# Altium schematic sheet 04_Main.SchDoc
size 779 x 360 mm; DsnPath: C:\Users\nilot\Documents\VSCode\SBC\imports\SG2002_QFN88_38_20230301_4L_V1.3_16.2.DSN; SchematicName: CV181xC_QFN88_38_DemoBoard; PageName: 04_Main; PageSize: Custom; TopSchematic: True
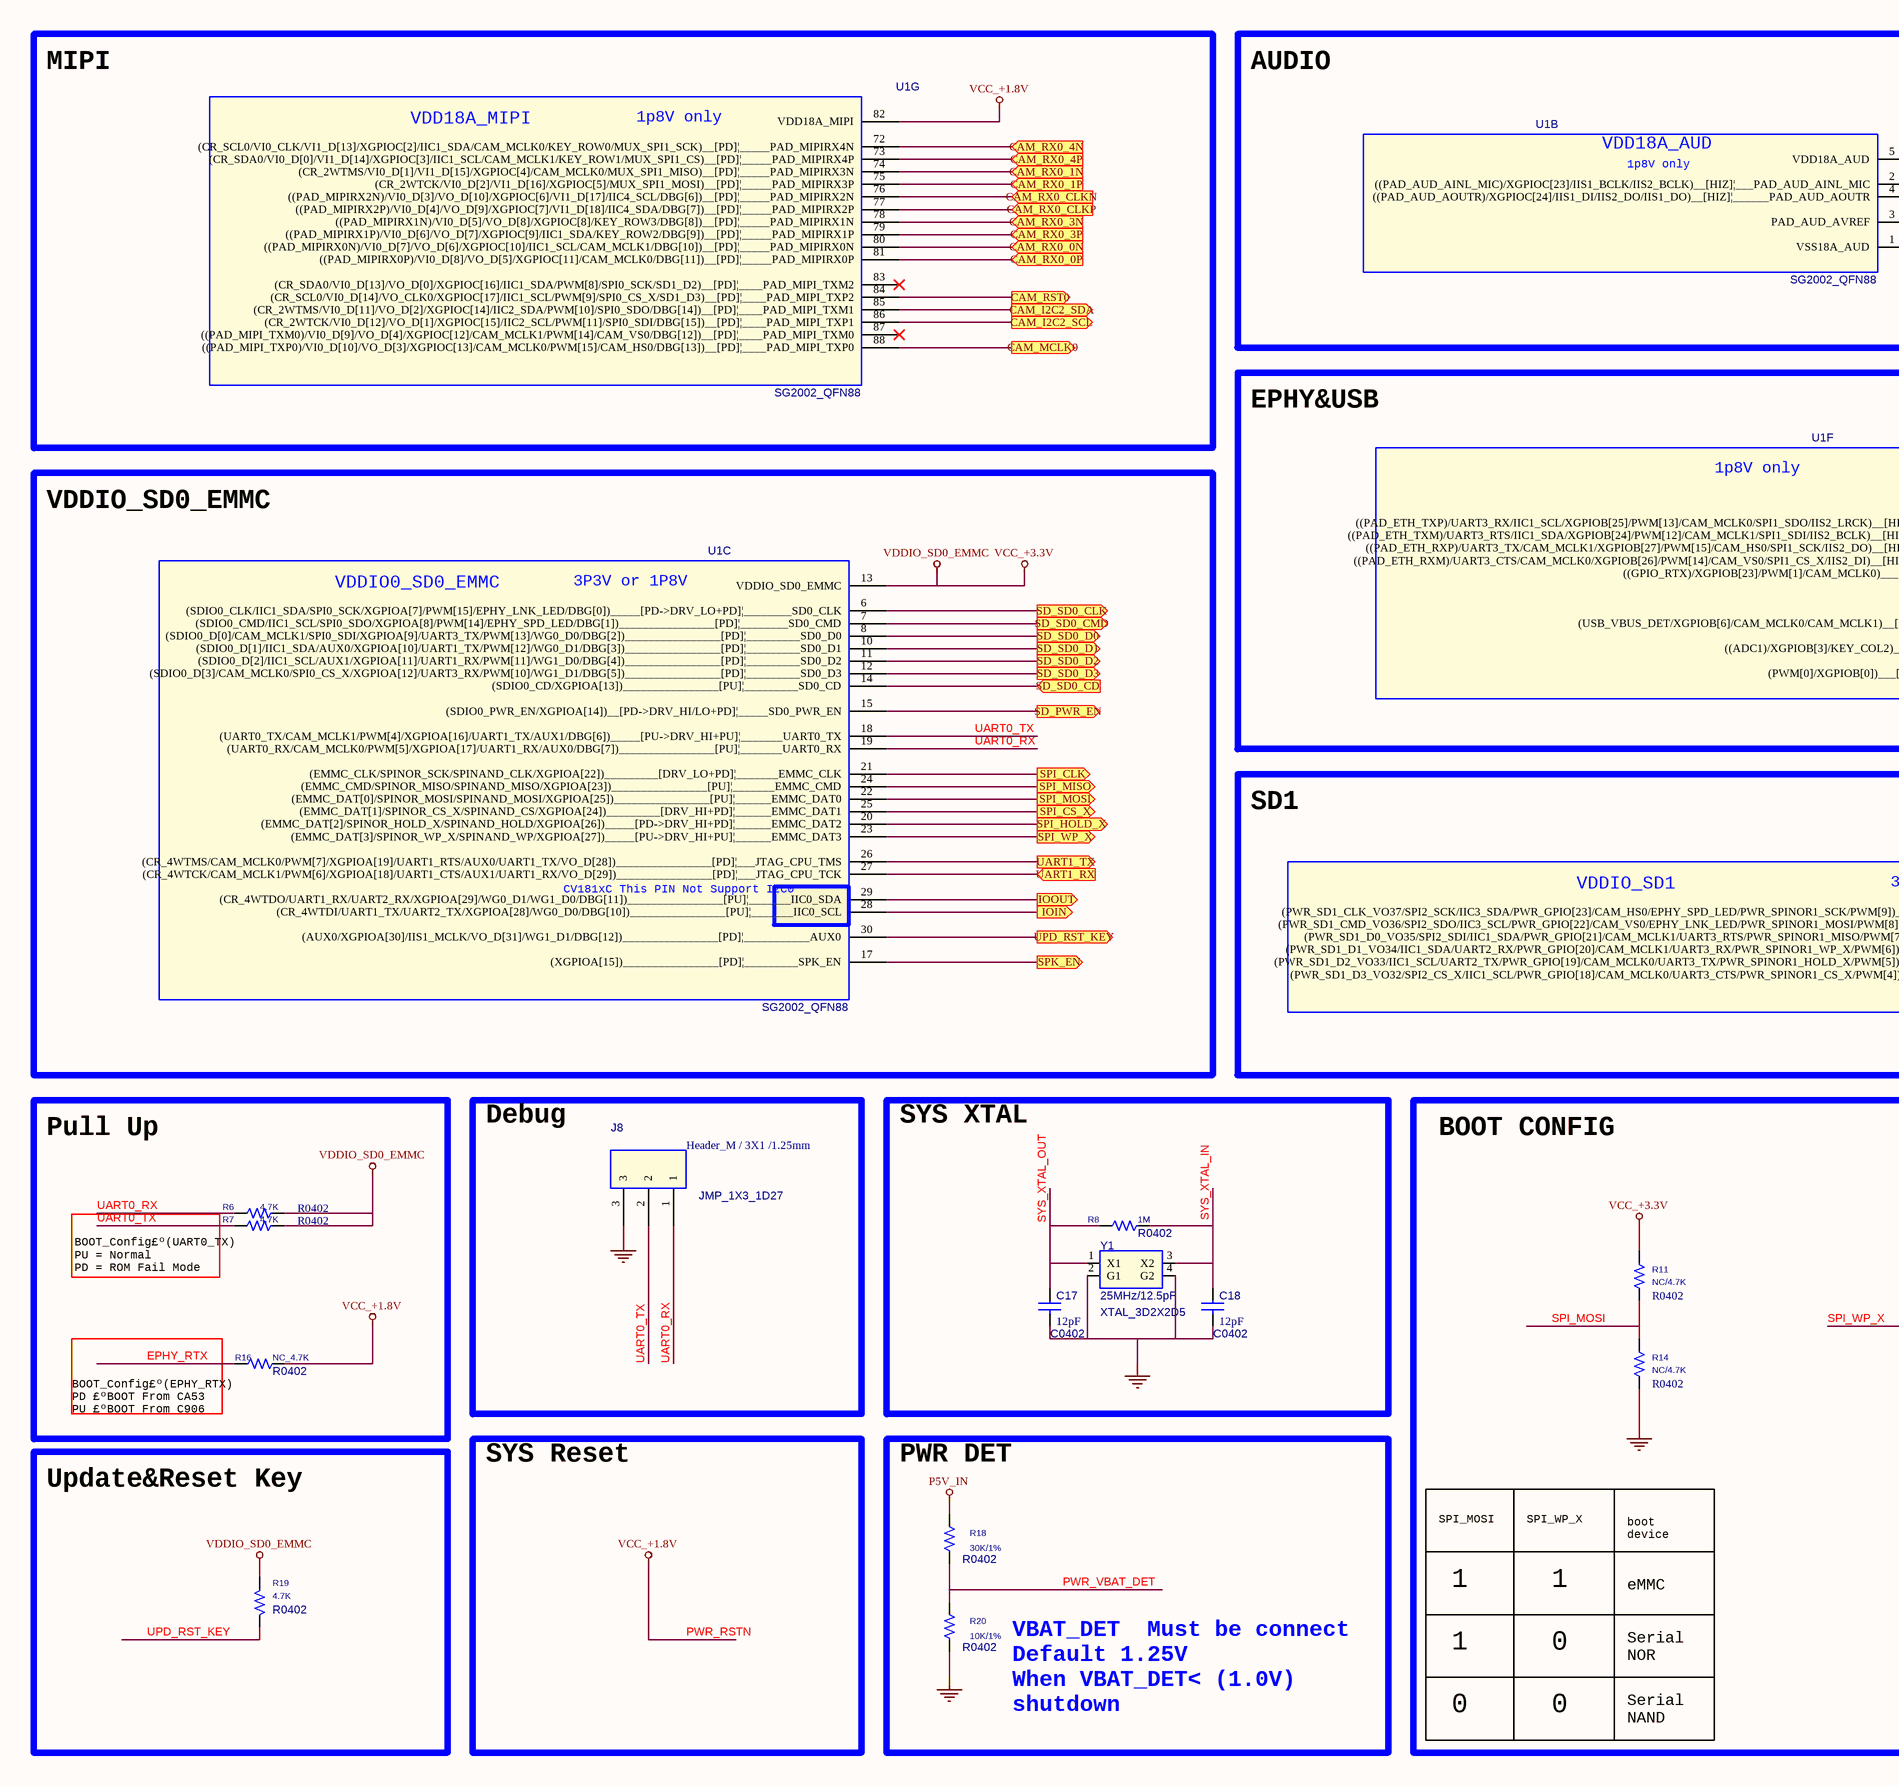
[diagram p0: 04_Main.SchDoc, left]
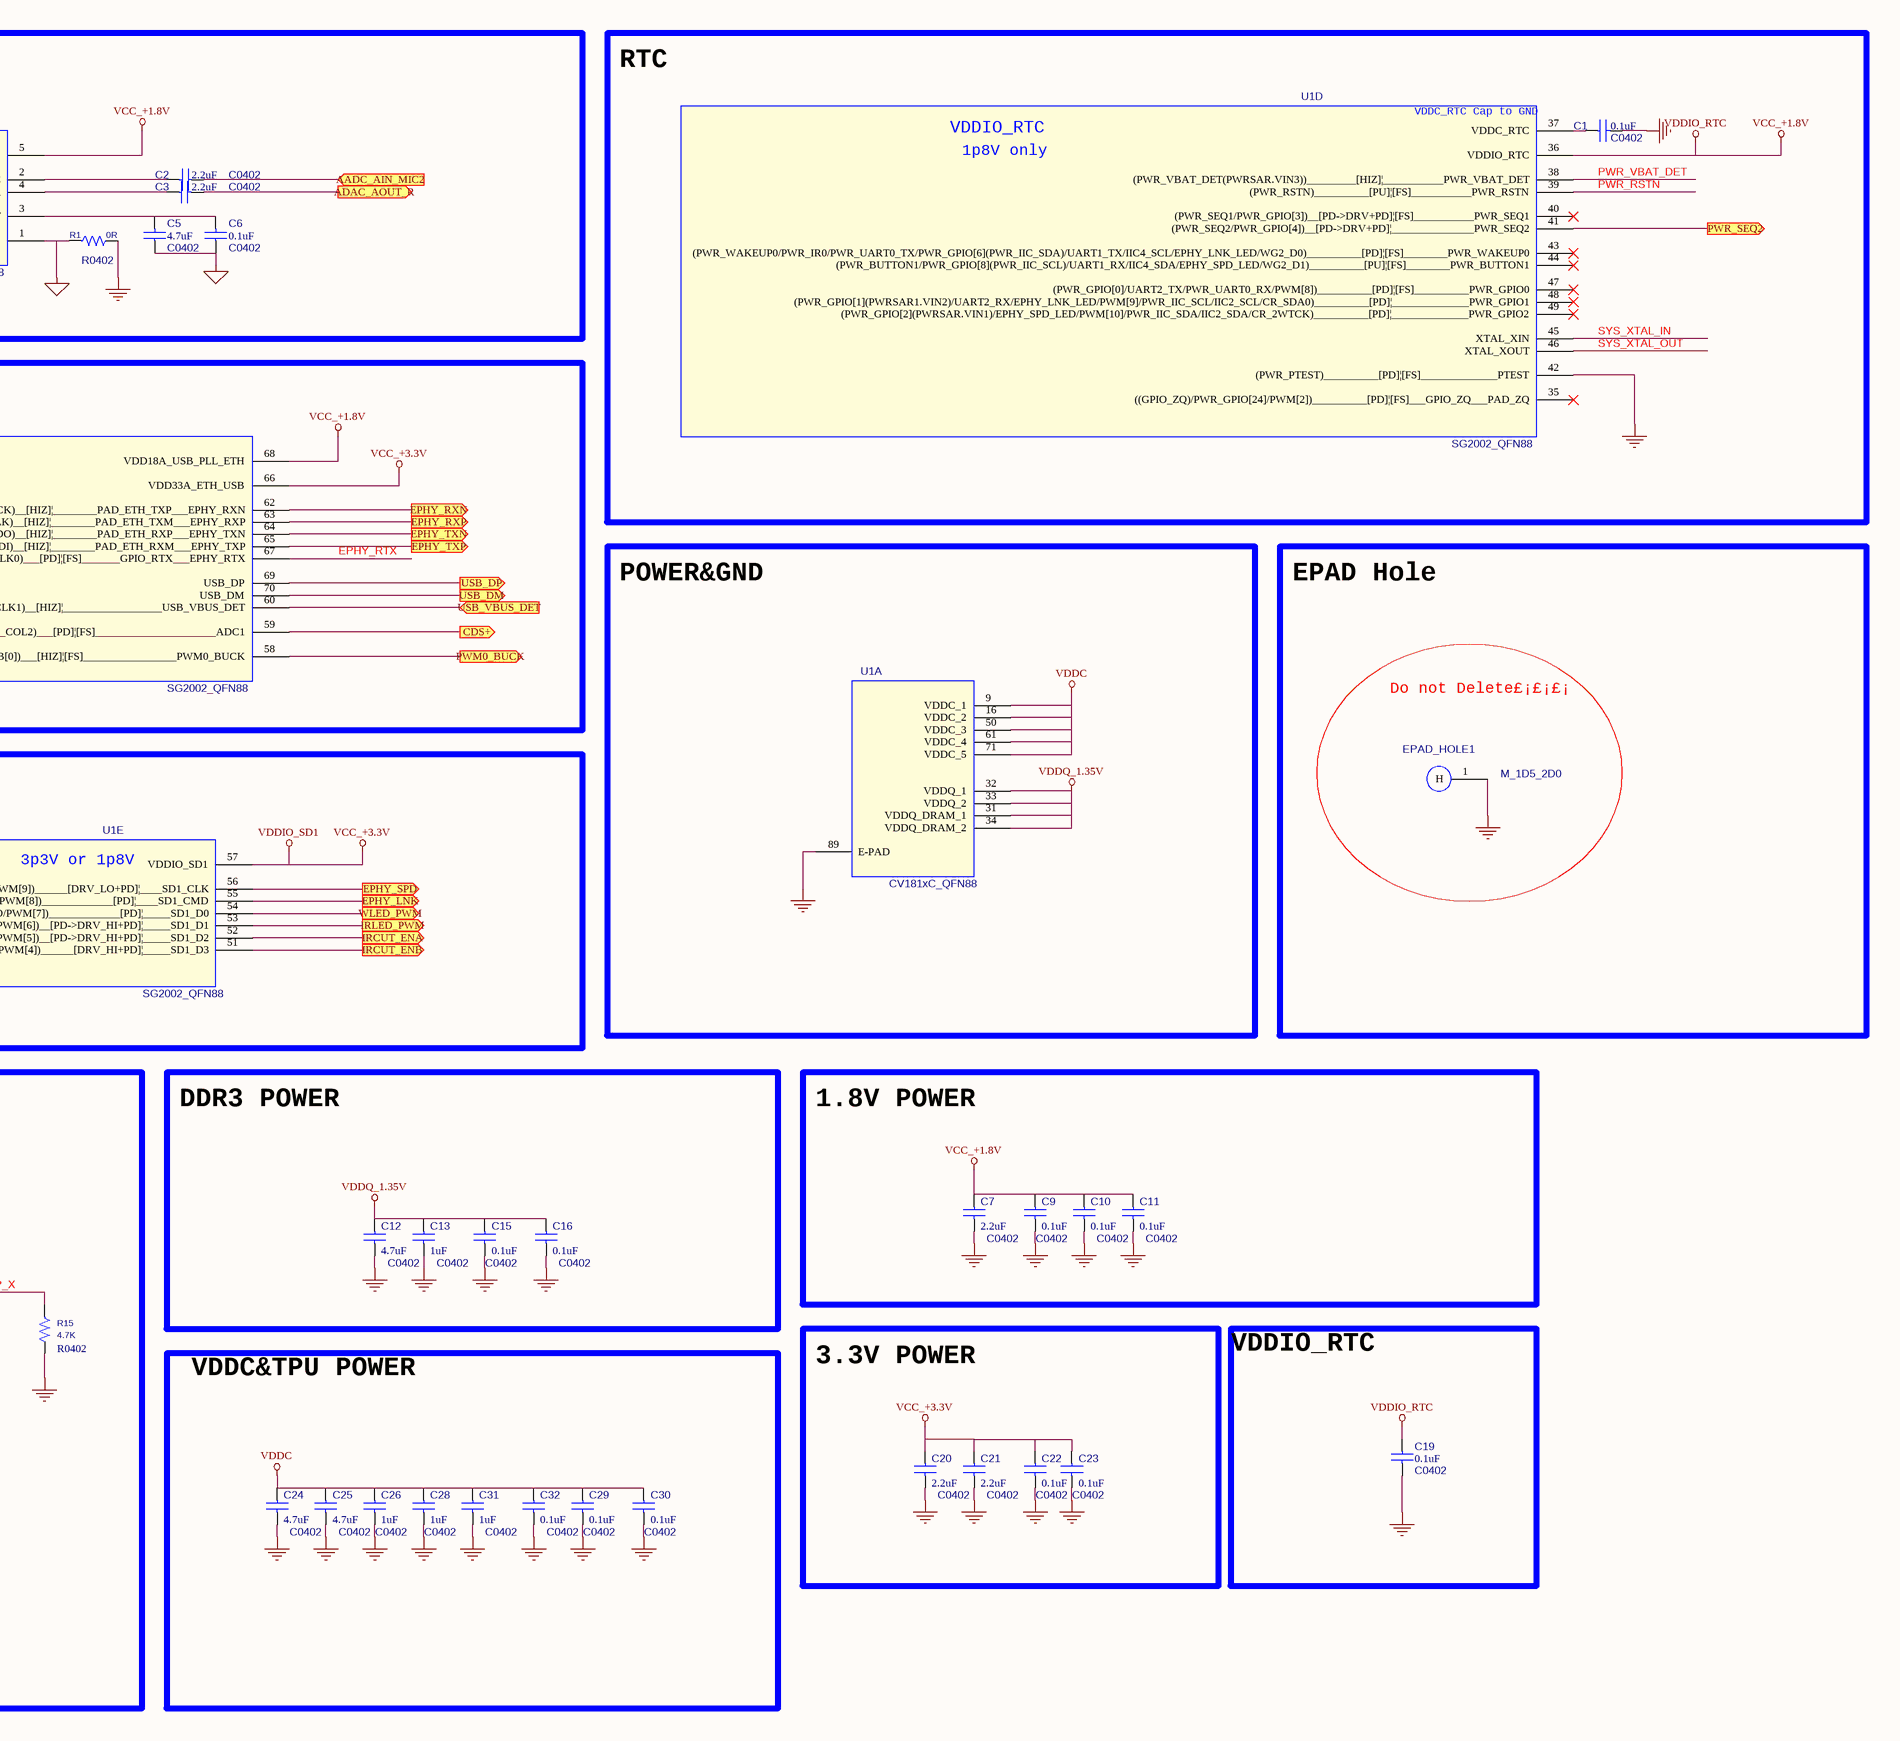
[diagram p1: 04_Main.SchDoc, right]

## Parts
C1  0.1uF  [C0402]
C2  2.2uF  [C0402]
C3  2.2uF  [C0402]
C5  4.7uF  [C0402]
C6  0.1uF  [C0402]
C7  2.2uF  [C0402]
C9  0.1uF  [C0402]
C10  0.1uF  [C0402]
C11  0.1uF  [C0402]
C12  4.7uF  [C0402]
C13  1uF  [C0402]
C15  0.1uF  [C0402]
C16  0.1uF  [C0402]
C17  12pF  [C0402]
C18  12pF  [C0402]
C19  0.1uF  [C0402]
C20  2.2uF  [C0402]
C21  2.2uF  [C0402]
C22  0.1uF  [C0402]
C23  0.1uF  [C0402]
C24  4.7uF  [C0402]
C25  4.7uF  [C0402]
C26  1uF  [C0402]
C28  1uF  [C0402]
C29  0.1uF  [C0402]
C30  0.1uF  [C0402]
C31  1uF  [C0402]
C32  0.1uF  [C0402]
EPAD_HOLE1  PCB Footprint: M_1D5_2D0  [M3_5.5X7.0_3.5]  (hidden comment: H1)
J8  Header_M / 3X1 /1.25mm  [JMP_1X3_1D27]
R1  0R  [R0402]
R6  4.7K  [R0402]
R7  4.7K  [R0402]
R8  1M  [R0402]
R11  NC/4.7K  [R0402]
R14  NC/4.7K  [R0402]
R15  4.7K  [R0402]
R16  NC_4.7K  [R0402]
R18  30K/1%  [R0402]
R19  4.7K  [R0402]
R20  10K/1%  [R0402]
U1  CV181xC_QFN88  [QFN88_9D0X9D0_0D35_E]  (parts A,B,C,D,E,F,G of 7)
Y1  25MHz/12.5pF  PCB Footprint: XTAL_3D2X2D5  [SCRY4-3_2X2_5X0_9]

## Blocks framed on the sheet
MIPI: U1
AUDIO: C2 C3 C5 C6 R1 U1
RTC: C1 U1
EPHY&USB: U1
VDDIO_SD0_EMMC: U1
POWER&GND: U1
EPAD Hole: EPAD_HOLE1
SD1: U1
Pull Up: R6 R7 R16
Debug: J8
SYS XTAL: C17 C18 R8 Y1
DDR3 POWER: C12 C13 C15 C16
1.8V POWER: C7 C9-C11
VDDC&TPU POWER: C24-C26 C28-C32
3.3V POWER: C20-C23
VDDIO_RTC: C19
Update&Reset Key: R19
PWR DET: R18 R20

## Ports
AADC_AIN_MIC2 (in), ADAC_AOUT_R (out), CAM_I2C2_SCL (out), CAM_I2C2_SDA (out), CAM_MCLK0 (out), CAM_RST0 (out), CAM_RX0_0N (in), CAM_RX0_0P (in), CAM_RX0_1N (in), CAM_RX0_1P (in), CAM_RX0_3N (in), CAM_RX0_3P (in), CAM_RX0_4N (in), CAM_RX0_4P (in), CAM_RX0_CLKN (in), CAM_RX0_CLKP (in), CDS+ (out), EPHY_LNK (out), EPHY_RXN (out), EPHY_RXP (out), EPHY_SPD (out), EPHY_TXN (out), EPHY_TXP (out), IOIN (out), IOOUT (out), IRCUT_ENA (out), IRCUT_ENB (out), IRLED_PWM (out), PWM0_BUCK (out), PWR_SEQ2 (out), SD_PWR_EN (out), SD_SD0_CD (in), SD_SD0_CLK (out), SD_SD0_CMD (out), SD_SD0_D0 (out), SD_SD0_D1 (out), SD_SD0_D2 (out), SD_SD0_D3 (out), SPI_CLK (out), SPI_CS_X (out), SPI_HOLD_X (out), SPI_MISO (out), SPI_MOSI (out), SPI_WP_X (out), SPK_EN (out), UART1_RX (in), UART1_TX (out), UPD_RST_KEY (out), USB_DM (out), USB_DP (out), USB_VBUS_DET (in), WLED_PWM (out)

## Nets
GND: C1.2 C7.2 C9.2 C10.2 C11.2 C12.2 C13.2 C15.2 C16.2 C17.2 C18.2 C19.2 C20.2 C21.2 C22.2 C23.2 C24.2 C25.2 C26.2 C28.2 C29.2 C30.2 C31.2 C32.2 EPAD_HOLE1.1(H) J8.3 R1.2 R14.2 R15.2 R20.1 U1.42((PWR_PTEST)__________[PD]|[FS]______________PTEST) U1.89(E-PAD) Y1.2(G1) Y1.4(G2)
GND_SIGNAL: C5.1 C6.1 R1.1 U1.1(VSS18A_AUD)
P5V_IN: R18.2
PWR_RSTN: C7.1 C9.1 C10.1 C11.1 C19.1 R16.2 U1.5(VDD18A_AUD) U1.36(VDDIO_RTC) U1.39((PWR_RSTN)__________[PU]|[FS]___________PWR_RSTN) U1.68(VDD18A_USB_PLL_ETH) U1.82(VDD18A_MIPI)  [also labelled VCC_+1.8V, VDDIO_RTC]
VCC_+3.3V: C20.1 C21.1 C22.1 C23.1 R6.1 R7.1 R11.1 R19.1 U1.13(VDDIO_SD0_EMMC) U1.57(VDDIO_SD1) U1.66(VDD33A_ETH_USB)  [also labelled VDDIO_SD0_EMMC, VDDIO_SD1]
VDDC: C24.1 C25.1 C26.1 C28.1 C29.1 C30.1 C31.1 C32.1 U1.9(VDDC_1) U1.16(VDDC_2) U1.50(VDDC_3) U1.61(VDDC_4) U1.71(VDDC_5)
VDDQ_1.35V: C12.1 C13.1 C15.1 C16.1 U1.31(VDDQ_DRAM_1) U1.32(VDDQ_1) U1.33(VDDQ_2) U1.34(VDDQ_DRAM_2)
AADC_AIN_MIC2: C2.1 ; port AADC_AIN_MIC2
ADAC_AOUT_R: C3.2 ; port ADAC_AOUT_R
CAM_I2C2_SCL: U1.86((CR_2WTCK/VI0_D[12]/VO_D[1]/XGPIOC[15]/IIC2_SCL/PWM[11]/SPI0_SDI/DBG[15])__[PD]|____PAD_MIPI_TXP1) ; port CAM_I2C2_SCL
CAM_I2C2_SDA: U1.85((CR_2WTMS/VI0_D[11]/VO_D[2]/XGPIOC[14]/IIC2_SDA/PWM[10]/SPI0_SDO/DBG[14])__[PD]|____PAD_MIPI_TXM1) ; port CAM_I2C2_SDA
CAM_MCLK0: U1.88(((PAD_MIPI_TXP0)/VI0_D[10]/VO_D[3]/XGPIOC[13]/CAM_MCLK0/PWM[15]/CAM_HS0/DBG[13])__[PD]|____PAD_MIPI_TXP0) ; port CAM_MCLK0
CAM_RST0: U1.84((CR_SCL0/VI0_D[14]/VO_CLK0/XGPIOC[17]/IIC1_SCL/PWM[9]/SPI0_CS_X/SD1_D3)__[PD]|____PAD_MIPI_TXP2) ; port CAM_RST0
CAM_RX0_0N: U1.80(((PAD_MIPIRX0N)/VI0_D[7]/VO_D[6]/XGPIOC[10]/IIC1_SCL/CAM_MCLK1/DBG[10])__[PD]|_____PAD_MIPIRX0N) ; port CAM_RX0_0N
CAM_RX0_0P: U1.81(((PAD_MIPIRX0P)/VI0_D[8]/VO_D[5]/XGPIOC[11]/CAM_MCLK0/DBG[11])__[PD]|_____PAD_MIPIRX0P) ; port CAM_RX0_0P
CAM_RX0_1N: U1.74((CR_2WTMS/VI0_D[1]/VI1_D[15]/XGPIOC[4]/CAM_MCLK0/MUX_SPI1_MISO)__[PD]|_____PAD_MIPIRX3N) ; port CAM_RX0_1N
CAM_RX0_1P: U1.75((CR_2WTCK/VI0_D[2]/VI1_D[16]/XGPIOC[5]/MUX_SPI1_MOSI)__[PD]|_____PAD_MIPIRX3P) ; port CAM_RX0_1P
CAM_RX0_3N: U1.78(((PAD_MIPIRX1N)/VI0_D[5]/VO_D[8]/XGPIOC[8]/KEY_ROW3/DBG[8])__[PD]|_____PAD_MIPIRX1N) ; port CAM_RX0_3N
CAM_RX0_3P: U1.79(((PAD_MIPIRX1P)/VI0_D[6]/VO_D[7]/XGPIOC[9]/IIC1_SDA/KEY_ROW2/DBG[9])__[PD]|_____PAD_MIPIRX1P) ; port CAM_RX0_3P
CAM_RX0_4N: U1.72((CR_SCL0/VI0_CLK/VI1_D[13]/XGPIOC[2]/IIC1_SDA/CAM_MCLK0/KEY_ROW0/MUX_SPI1_SCK)__[PD]|_____PAD_MIPIRX4N) ; port CAM_RX0_4N
CAM_RX0_4P: U1.73((CR_SDA0/VI0_D[0]/VI1_D[14]/XGPIOC[3]/IIC1_SCL/CAM_MCLK1/KEY_ROW1/MUX_SPI1_CS)__[PD]|_____PAD_MIPIRX4P) ; port CAM_RX0_4P
CAM_RX0_CLKN: U1.76(((PAD_MIPIRX2N)/VI0_D[3]/VO_D[10]/XGPIOC[6]/VI1_D[17]/IIC4_SCL/DBG[6])__[PD]|_____PAD_MIPIRX2N) ; port CAM_RX0_CLKN
CAM_RX0_CLKP: U1.77(((PAD_MIPIRX2P)/VI0_D[4]/VO_D[9]/XGPIOC[7]/VI1_D[18]/IIC4_SDA/DBG[7])__[PD]|_____PAD_MIPIRX2P) ; port CAM_RX0_CLKP
CDS+: U1.59(((ADC1)/XGPIOB[3]/KEY_COL2)___[PD]|[FS]______________________ADC1) ; port CDS+
EPHY_LNK: U1.55((PWR_SD1_CMD_VO36/SPI2_SDO/IIC3_SCL/PWR_GPIO[22]/CAM_VS0/EPHY_LNK_LED/PWR_SPINOR1_MOSI/PWM[8])_____________[PD]|____SD1_CMD) ; port EPHY_LNK
EPHY_RTX: R16.1 U1.67(((GPIO_RTX)/XGPIOB[23]/PWM[1]/CAM_MCLK0)___[PD]|[FS]_______GPIO_RTX___EPHY_RTX)
EPHY_RXN: U1.62(((PAD_ETH_TXP)/UART3_RX/IIC1_SCL/XGPIOB[25]/PWM[13]/CAM_MCLK0/SPI1_SDO/IIS2_LRCK)__[HIZ]|________PAD_ETH_TXP___EPHY_RXN) ; port EPHY_RXN
EPHY_RXP: U1.63(((PAD_ETH_TXM)/UART3_RTS/IIC1_SDA/XGPIOB[24]/PWM[12]/CAM_MCLK1/SPI1_SDI/IIS2_BCLK)__[HIZ]|________PAD_ETH_TXM___EPHY_RXP) ; port EPHY_RXP
EPHY_SPD: U1.56((PWR_SD1_CLK_VO37/SPI2_SCK/IIC3_SDA/PWR_GPIO[23]/CAM_HS0/EPHY_SPD_LED/PWR_SPINOR1_SCK/PWM[9])______[DRV_LO+PD]|____SD1_CLK) ; port EPHY_SPD
EPHY_TXN: U1.64(((PAD_ETH_RXP)/UART3_TX/CAM_MCLK1/XGPIOB[27]/PWM[15]/CAM_HS0/SPI1_SCK/IIS2_DO)__[HIZ]|________PAD_ETH_RXP___EPHY_TXN) ; port EPHY_TXN
EPHY_TXP: U1.65(((PAD_ETH_RXM)/UART3_CTS/CAM_MCLK0/XGPIOB[26]/PWM[14]/CAM_VS0/SPI1_CS_X/IIS2_DI)__[HIZ]|________PAD_ETH_RXM___EPHY_TXP) ; port EPHY_TXP
IOIN: U1.28((CR_4WTDI/UART1_TX/UART2_TX/XGPIOA[28]/WG0_D0/DBG[10])________________[PU]|_______IIC0_SCL) ; port IOIN
IOOUT: U1.29((CR_4WTDO/UART1_RX/UART2_RX/XGPIOA[29]/WG0_D1/WG1_D0/DBG[11])________________[PU]|_______IIC0_SDA) ; port IOOUT
IRCUT_ENA: U1.52((PWR_SD1_D2_VO33/IIC1_SCL/UART2_TX/PWR_GPIO[19]/CAM_MCLK0/UART3_TX/PWR_SPINOR1_HOLD_X/PWM[5])__[PD->DRV_HI+PD]|_____SD1_D2) ; port IRCUT_ENA
IRCUT_ENB: U1.51((PWR_SD1_D3_VO32/SPI2_CS_X/IIC1_SCL/PWR_GPIO[18]/CAM_MCLK0/UART3_CTS/PWR_SPINOR1_CS_X/PWM[4])______[DRV_HI+PD]|_____SD1_D3) ; port IRCUT_ENB
IRLED_PWM: U1.53((PWR_SD1_D1_VO34/IIC1_SDA/UART2_RX/PWR_GPIO[20]/CAM_MCLK1/UART3_RX/PWR_SPINOR1_WP_X/PWM[6])__[PD->DRV_HI+PD]|_____SD1_D1) ; port IRLED_PWM
PWM0_BUCK: U1.58((PWM[0]/XGPIOB[0])___[HIZ]|[FS]_________________PWM0_BUCK) ; port PWM0_BUCK
PWR_SEQ2: U1.41((PWR_SEQ2/PWR_GPIO[4])__[PD->DRV+PD]|_______________PWR_SEQ2) ; port PWR_SEQ2
PWR_VBAT_DET: R18.1 R20.2 U1.38((PWR_VBAT_DET(PWRSAR.VIN3))_________[HIZ]|___________PWR_VBAT_DET)
SD_PWR_EN: U1.15((SDIO0_PWR_EN/XGPIOA[14])__[PD->DRV_HI/LO+PD]|_____SD0_PWR_EN) ; port SD_PWR_EN
SD_SD0_CD: U1.14((SDIO0_CD/XGPIOA[13])________________[PU]|_________SD0_CD) ; port SD_SD0_CD
SD_SD0_CLK: U1.6((SDIO0_CLK/IIC1_SDA/SPI0_SCK/XGPIOA[7]/PWM[15]/EPHY_LNK_LED/DBG[0])_____[PD->DRV_LO+PD]|________SD0_CLK) ; port SD_SD0_CLK
SD_SD0_CMD: U1.7((SDIO0_CMD/IIC1_SCL/SPI0_SDO/XGPIOA[8]/PWM[14]/EPHY_SPD_LED/DBG[1])________________[PD]|________SD0_CMD) ; port SD_SD0_CMD
SD_SD0_D0: U1.8((SDIO0_D[0]/CAM_MCLK1/SPI0_SDI/XGPIOA[9]/UART3_TX/PWM[13]/WG0_D0/DBG[2])________________[PD]|_________SD0_D0) ; port SD_SD0_D0
SD_SD0_D1: U1.10((SDIO0_D[1]/IIC1_SDA/AUX0/XGPIOA[10]/UART1_TX/PWM[12]/WG0_D1/DBG[3])________________[PD]|_________SD0_D1) ; port SD_SD0_D1
SD_SD0_D2: U1.11((SDIO0_D[2]/IIC1_SCL/AUX1/XGPIOA[11]/UART1_RX/PWM[11]/WG1_D0/DBG[4])________________[PD]|_________SD0_D2) ; port SD_SD0_D2
SD_SD0_D3: U1.12((SDIO0_D[3]/CAM_MCLK0/SPI0_CS_X/XGPIOA[12]/UART3_RX/PWM[10]/WG1_D1/DBG[5])________________[PD]|_________SD0_D3) ; port SD_SD0_D3
SPI_CLK: U1.21((EMMC_CLK/SPINOR_SCK/SPINAND_CLK/XGPIOA[22])_________[DRV_LO+PD]|_______EMMC_CLK) ; port SPI_CLK
SPI_CS_X: U1.25((EMMC_DAT[1]/SPINOR_CS_X/SPINAND_CS/XGPIOA[24])_________[DRV_HI+PD]|______EMMC_DAT1) ; port SPI_CS_X
SPI_HOLD_X: U1.20((EMMC_DAT[2]/SPINOR_HOLD_X/SPINAND_HOLD/XGPIOA[26])_____[PD->DRV_HI+PD]|______EMMC_DAT2) ; port SPI_HOLD_X
SPI_MISO: U1.24((EMMC_CMD/SPINOR_MISO/SPINAND_MISO/XGPIOA[23])________________[PU]|_______EMMC_CMD) ; port SPI_MISO
SPI_MOSI: R11.2 R14.1
SPI_MOSI: U1.22((EMMC_DAT[0]/SPINOR_MOSI/SPINAND_MOSI/XGPIOA[25])________________[PU]|______EMMC_DAT0) ; port SPI_MOSI  [a separate net that carries the same name]
SPI_WP_X: R15.1
SPI_WP_X: U1.23((EMMC_DAT[3]/SPINOR_WP_X/SPINAND_WP/XGPIOA[27])_____[PU->DRV_HI+PU]|______EMMC_DAT3) ; port SPI_WP_X  [a separate net that carries the same name]
SPK_EN: U1.17((XGPIOA[15])________________[PD]|_________SPK_EN) ; port SPK_EN
SYS_XTAL_IN: C18.1 R8.1 U1.45(XTAL_XIN) Y1.3(X2)
SYS_XTAL_OUT: C17.1 R8.2 U1.46(XTAL_XOUT) Y1.1(X1)
UART0_RX: J8.1 R6.2 U1.19((UART0_RX/CAM_MCLK0/PWM[5]/XGPIOA[17]/UART1_RX/AUX0/DBG[7])________________[PU]|_______UART0_RX)
UART0_TX: J8.2 R7.2 U1.18((UART0_TX/CAM_MCLK1/PWM[4]/XGPIOA[16]/UART1_TX/AUX1/DBG[6])_____[PU->DRV_HI+PU]|_______UART0_TX)
UART1_RX: U1.27((CR_4WTCK/CAM_MCLK1/PWM[6]/XGPIOA[18]/UART1_CTS/AUX1/UART1_RX/VO_D[29])________________[PD]|___JTAG_CPU_TCK) ; port UART1_RX
UART1_TX: U1.26((CR_4WTMS/CAM_MCLK0/PWM[7]/XGPIOA[19]/UART1_RTS/AUX0/UART1_TX/VO_D[28])________________[PD]|___JTAG_CPU_TMS) ; port UART1_TX
UPD_RST_KEY: R19.2
UPD_RST_KEY: U1.30((AUX0/XGPIOA[30]/IIS1_MCLK/VO_D[31]/WG1_D1/DBG[12])________________[PD]|___________AUX0) ; port UPD_RST_KEY  [a separate net that carries the same name]
USB_DM: U1.70(USB_DM) ; port USB_DM
USB_DP: U1.69(USB_DP) ; port USB_DP
USB_VBUS_DET: U1.60((USB_VBUS_DET/XGPIOB[6]/CAM_MCLK0/CAM_MCLK1)__[HIZ]|__________________USB_VBUS_DET) ; port USB_VBUS_DET
WLED_PWM: U1.54((PWR_SD1_D0_VO35/SPI2_SDI/IIC1_SDA/PWR_GPIO[21]/CAM_MCLK1/UART3_RTS/PWR_SPINOR1_MISO/PWM[7])_____________[PD]|_____SD1_D0) ; port WLED_PWM
NetC1_1: C1.1 U1.37(VDDC_RTC)
NetC2_2: C2.2 U1.2(((PAD_AUD_AINL_MIC)/XGPIOC[23]/IIS1_BCLK/IIS2_BCLK)__[HIZ]|___PAD_AUD_AINL_MIC)
NetC3_1: C3.1 U1.4(((PAD_AUD_AOUTR)/XGPIOC[24]/IIS1_DI/IIS2_DO/IIS1_DO)__[HIZ]|______PAD_AUD_AOUTR)
NetC5_2: C5.2 C6.2 U1.3(PAD_AUD_AVREF)

Not connected (* = marked no-connect by the designer): U1 35(((GPIO_ZQ)/PWR_GPIO[24]/PWM[2])__________[PD]|[FS]___GPIO_ZQ___PAD_ZQ)* 40((PWR_SEQ1/PWR_GPIO[3])__[PD->DRV+PD]|[FS]___________PWR_SEQ1)* 43((PWR_WAKEUP0/PWR_IR0/PWR_UART0_TX/PWR_GPIO[6](PWR_IIC_SDA)/UART1_TX/IIC4_SCL/EPHY_LNK_LED/WG2_D0)__________[PD]|[FS]________PWR_WAKEUP0)* 44((PWR_BUTTON1/PWR_GPIO[8](PWR_IIC_SCL)/UART1_RX/IIC4_SDA/EPHY_SPD_LED/WG2_D1)__________[PU]|[FS]________PWR_BUTTON1)* 47((PWR_GPIO[0]/UART2_TX/PWR_UART0_RX/PWM[8])__________[PD]|[FS]__________PWR_GPIO0)* 48((PWR_GPIO[1](PWRSAR1.VIN2)/UART2_RX/EPHY_LNK_LED/PWM[9]/PWR_IIC_SCL/IIC2_SCL/CR_SDA0)__________[PD]|______________PWR_GPIO1)* 49((PWR_GPIO[2](PWRSAR.VIN1)/EPHY_SPD_LED/PWM[10]/PWR_IIC_SDA/IIC2_SDA/CR_2WTCK)__________[PD]|______________PWR_GPIO2)* 83((CR_SDA0/VI0_D[13]/VO_D[0]/XGPIOC[16]/IIC1_SDA/PWM[8]/SPI0_SCK/SD1_D2)__[PD]|____PAD_MIPI_TXM2)* 87(((PAD_MIPI_TXM0)/VI0_D[9]/VO_D[4]/XGPIOC[12]/CAM_MCLK1/PWM[14]/CAM_VS0/DBG[12])__[PD]|____PAD_MIPI_TXM0)*

## Notes on the sheet
- Do not Delete£¡£¡£¡
- BOOT CONFIG
- BOOT_Config£º(UART0_TX)
  PU = Normal
  PD = ROM Fail Mode
- (near R16) BOOT_Config£º(EPHY_RTX)
  PD £ºBOOT From CA53
  PU £ºBOOT From C906
- SYS Reset
- SPI_MOSI
- SPI_WP_X
- boot device
  selection
- VBAT_DET  Must be connect
  Default 1.25V
  When VBAT_DET< (1.0V)
  shutdown
- 1
- eMMC
- Serial
  NOR
- 0
- Serial
  NAND
- (in symbol Mars_CV181XC_QFN88, part B) 1p8V only
- (in symbol Mars_CV181XC_QFN88, part C) VDDIO0_SD0_EMMC; 3P3V or 1P8V; CV181xC This PIN Not Support I2C0
- (in symbol Mars_CV181XC_QFN88, part D) VDDC_RTC Cap to GND; 1p8V only
- (in symbol Mars_CV181XC_QFN88, part E) 3p3V or 1p8V
- (in symbol Mars_CV181XC_QFN88, part F) 1p8V only
- (in symbol Mars_CV181XC_QFN88, part G) 1p8V only

## Library data of the parts
C1 = C: C0201; Part Number: GRM155R61E104KA87D; Part Reference: C1; Cloud IC Number: Y02110431K00; Vendor: murata; Part Name: C0201; Value: 0.1uF; PCB Footprint: C0402
C2 = C: C0402; Part Name: sC0402; Part Number: GRM155R61E104KA87D; Part Reference: C2; Cloud IC Number: Y02110431K00; Vendor: murata; Value: 2.2uF; PCB Footprint: C0402
C3 = C: C0402; Part Name: sC0402; Part Number: GRM155R61E104KA87D; Part Reference: C3; Cloud IC Number: Y02110431K00; Vendor: murata; Value: 2.2uF; PCB Footprint: C0402
C5 = C: C0603; Part Number: GRM155R61E104KA87D; Part Reference: C5; Cloud IC Number: Y02110431K00; Vendor: murata; Part Name: C0603; Value: 4.7uF; PCB Footprint: C0402
C6 = C: C0603; Part Number: GRM155R61E104KA87D; Part Reference: C6; Cloud IC Number: Y02110431K00; Vendor: murata; Part Name: C0603; Value: 0.1uF; PCB Footprint: C0402
C7 = C: C0402; Part Number: GRM155R61E104KA87D; Part Reference: C7; Cloud IC Number: Y02110431K00; Vendor: murata; Part Name: C0402; Value: 2.2uF; PCB Footprint: C0402
C9 = C: C0201; Part Number: GRM155R61E104KA87D; Part Reference: C9; Cloud IC Number: Y02110431K00; Vendor: murata; Part Name: C0201; Value: 0.1uF; PCB Footprint: C0402
C10 = C: C0201; Part Number: GRM155R61E104KA87D; Part Reference: C10; Cloud IC Number: Y02110431K00; Vendor: murata; Part Name: C0201; Value: 0.1uF; PCB Footprint: C0402
C11 = C: C0201; Part Number: GRM155R61E104KA87D; Part Reference: C11; Cloud IC Number: Y02110431K00; Vendor: murata; Part Name: C0201; Value: 0.1uF; PCB Footprint: C0402
C12 = C: C0402; Part Number: GRM155R61E104KA87D; Part Reference: C12; Cloud IC Number: Y02110431K00; Vendor: murata; Part Name: C0402; Value: 4.7uF; PCB Footprint: C0402
C13 = C: C0402; Part Number: GRM155R61E104KA87D; Part Reference: C13; Cloud IC Number: Y02110431K00; Vendor: murata; Part Name: C0402; Value: 1uF; PCB Footprint: C0402
C15 = C: C0201; Part Number: GRM155R61E104KA87D; Part Reference: C15; Cloud IC Number: Y02110431K00; Vendor: murata; Part Name: C0201; Value: 0.1uF; PCB Footprint: C0402
C16 = C: C0201; Part Number: GRM155R61E104KA87D; Part Reference: C16; Cloud IC Number: Y02110431K00; Vendor: murata; Part Name: C0201; Value: 0.1uF; PCB Footprint: C0402
C17 = C: C0402; Part Number: GRM155R61E104KA87D; Part Reference: C17; Cloud IC Number: Y02110431K00; Vendor: murata; Part Name: C0402; Value: 12pF; PCB Footprint: C0402
C18 = C: C0402; Part Number: GRM155R61E104KA87D; Part Reference: C18; Cloud IC Number: Y02110431K00; Vendor: murata; Part Name: C0402; Value: 12pF; PCB Footprint: C0402
C19 = C: C0201; Part Number: GRM155R61E104KA87D; Part Reference: C19; Cloud IC Number: Y02110431K00; Vendor: murata; Part Name: C0201; Value: 0.1uF; PCB Footprint: C0402
C20 = C: C0402; Part Number: GRM155R61E104KA87D; Part Reference: C20; Cloud IC Number: Y02110431K00; Vendor: murata; Part Name: C0402; Value: 2.2uF; PCB Footprint: C0402
C21 = C: C0402; Part Number: GRM155R61E104KA87D; Part Reference: C21; Cloud IC Number: Y02110431K00; Vendor: murata; Part Name: C0402; Value: 2.2uF; PCB Footprint: C0402
C22 = C: C0402; Part Number: GRM155R61E104KA87D; Part Reference: C22; Cloud IC Number: Y02110431K00; Vendor: murata; Part Name: C0402; Value: 0.1uF; PCB Footprint: C0402
C23 = C: C0201; Part Number: GRM155R61E104KA87D; Part Reference: C23; Cloud IC Number: Y02110431K00; Vendor: murata; Part Name: C0201; Value: 0.1uF; PCB Footprint: C0402
C24 = C: C0201; Part Number: GRM155R61E104KA87D; Part Reference: C24; Cloud IC Number: Y02110431K00; Vendor: murata; Part Name: C0201; Value: 4.7uF; PCB Footprint: C0402
C25 = C: C0402; Part Number: GRM155R61E104KA87D; Part Reference: C25; Cloud IC Number: Y02110431K00; Vendor: murata; Part Name: C0402; Value: 4.7uF; PCB Footprint: C0402
C26 = C: C0201; Part Number: GRM155R61E104KA87D; Part Reference: C26; Cloud IC Number: Y02110431K00; Vendor: murata; Part Name: C0201; Value: 1uF; PCB Footprint: C0402
C28 = C: C0201; Part Number: GRM155R61E104KA87D; Part Reference: C28; Cloud IC Number: Y02110431K00; Vendor: murata; Part Name: C0201; Value: 1uF; PCB Footprint: C0402
C29 = C: C0201; Part Number: GRM155R61E104KA87D; Part Reference: C29; Cloud IC Number: Y02110431K00; Vendor: murata; Part Name: C0201; Value: 0.1uF; PCB Footprint: C0402
C30 = C: C0201; Part Number: GRM155R61E104KA87D; Part Reference: C30; Cloud IC Number: Y02110431K00; Vendor: murata; Part Name: C0201; Value: 0.1uF; PCB Footprint: C0402
C31 = C: C0201; Part Number: GRM155R61E104KA87D; Part Reference: C31; Cloud IC Number: Y02110431K00; Vendor: murata; Part Name: C0201; Value: 1uF; PCB Footprint: C0402
C32 = C: C0201; Part Number: GRM155R61E104KA87D; Part Reference: C32; Cloud IC Number: Y02110431K00; Vendor: murata; Part Name: C0201; Value: 0.1uF; PCB Footprint: C0402
EPAD_HOLE1 = H: Part Reference: EPAD_HOLE1; Value: H1; Part Type: NC
J8 = HEADER 3X1_0.25mm: JMP_1X3_2.0; Part Number: CON_2p54_2X1; Part Reference: J8; Vendor: oupiin; Cloud IC Number: Y04C10202105; Value: Header_M / 3X1 /1.25mm; PCB Footprint: JMP_1X3_1D27; Part Name: JMP_1X3_2.0
R1 = R_Dup1: R0201; Part Reference: R1; Value: 0R; PCB Footprint: R0402; Part Name: R0201
R6 = R_Dup1: R0402; Part Reference: R6; Manufacturer Part number: Y01102201F00; Value: 4.7K; PCB Footprint: R0402; Part Name: R0402; Part Number: Y01102201F00
R7 = R_Dup1: R0402; Part Reference: R7; Manufacturer Part number: Y01102201F00; Value: 4.7K; PCB Footprint: R0402; Part Name: R0402; Part Number: Y01102201F00
R8 = R_Dup2: Part Reference: R8; Value: 1M; PCB Footprint: R0402
R11 = R_Dup1: R0402; Part Reference: R11; Manufacturer Part number: Y01104731F00; Value: NC/4.7K; PCB Footprint: R0402; Part Number: Y01104731F00; Part Name: R0402
R14 = R_Dup1: R0402; Part Reference: R14; Manufacturer Part number: Y01104731F00; Value: NC/4.7K; Part Number: Y01104731F00; Part Name: R0402; PCB Footprint: R0402
R15 = R_Dup1: R0402; Part Reference: R15; Part Number: Y01104731F00; Value: 4.7K; PCB Footprint: R0402; Part Name: R0402; Manufacturer Part number: Y01104731F00
R16 = R: R0402; Part Reference: R16; Value: NC_4.7K; PCB Footprint: R0402
R18 = R_Dup1: R0402; Part Reference: R18; Value: 30K/1%; PCB Footprint: R0402
R19 = R_Dup2: Part Reference: R19; Value: 4.7K; PCB Footprint: R0402
R20 = R_Dup1: R1206; Part Reference: R20; Value: 10K/1%; PCB Footprint: R0402; Part Name: R1206
U1 = Mars_CV181XC_QFN88: Part Reference: U1; SWAP_INFO: (S1+S2+S3+S4+S5+S6+S7); SPLIT_INST: TRUE; Value: CV181xC_QFN88; PCB Footprint: QFN88_9D0X9D0_0D35_E
Y1 = XTAL_25MHz_7: 25MHZ,3225 4PIN,SMT,12pF; Manufacturer: Taitien; Part Number: XXCBBCNANF-33.33MHz; Part Reference: Y1; Cloud IC Number: Y07425003120; BY: DTRUONG-www.amcc.com-02Apr10; MFG1: AVX; PACKAGE: 3M2X2M5x0M9; Value: 25MHz/12.5pF